# Altium schematic sheet Sheet_1_2026-11-08.schdoc
size 189 x 123 mm
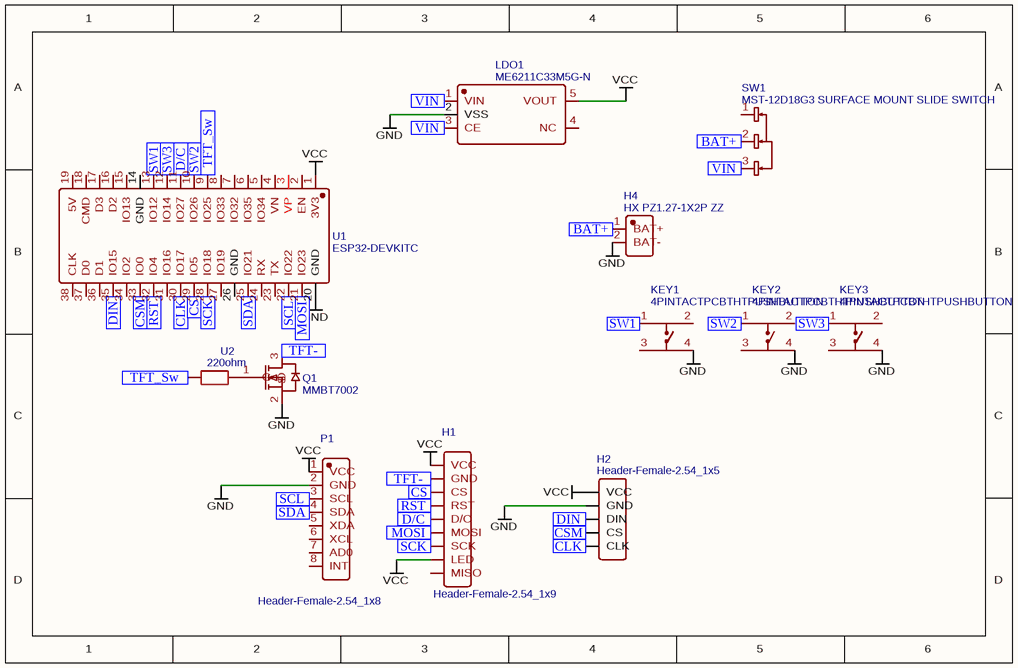
[diagram p0: Sheet_1_2026-11-08.schdoc]

## Parts
H1  Header-Female-2.54_1x9  [HDR-TH_9P-P2.54-V-F-1]
H2  Header-Female-2.54_1x5  [HDR-TH_5P-P2.54-V-F]
H4  HX PZ1.27-1X2P ZZ  [HDR-TH_HX-PZ1.27-1X2P-ZZ]
KEY1  4PINTACTPCBTHTPUSHBUTTON  [SW-SMD_4P-L6.0-W6.0-P4.50-LS10.0_TL3301EF160QG]
KEY2  4PINTACTPCBTHTPUSHBUTTON  [SW-SMD_4P-L6.0-W6.0-P4.50-LS10.0_TL3301EF160QG]
KEY3  4PINTACTPCBTHTPUSHBUTTON  [SW-SMD_4P-L6.0-W6.0-P4.50-LS10.0_TL3301EF160QG]
LDO1  ME6211C33M5G-N  [SOT-23-5_L3.0-W1.7-P0.95-LS2.8-BL]
P1  Header-Female-2.54_1x8  [HDR-TH_8P-P2.54-V-F]
Q1  MMBT7002  [SOT-23-3_L2.9-W1.6-P1.90-LS2.8-BR]
SW1  MST-12D18G3 SURFACE MOUNT SLIDE SWITCH  [SW-SMD_MST-12D18G4-SPDT-SLIDE-SWITCH]
U1  ESP32-DEVKITC  [BULETM-SMD_ESP32-DEVKITC]
U2  220ohm  [RES-TH_BD4.0-L10.7-P14.70-D0.8]

## Ports
BAT+ (in), CLK (in), CS (in), CSM (in), D/C (in), DIN (in), MOSI (in), RST (in), SCK (in), SCL (in), SDA (in), SW1 (in), SW2 (in), SW3 (in), TFT- (in), TFT_Sw (in), VIN (in)

## Nets
GND: H2.2(GND) H4.2(BAT-) KEY1.4 KEY2.4 KEY3.4 LDO1.2(VSS) P1.2(GND) Q1.2(S) U1.20(GND)
VCC: H1.1(VCC) H1.8(LED) H2.1(VCC) LDO1.5(VOUT) P1.1(VCC) U1.1(3V3)
BAT+: H4.1(BAT+) SW1.2 ; port BAT+
CLK: H2.5(CLK) U1.30(IO17) ; port CLK
CS: H1.3(CS) U1.29(IO5) ; port CS
CSM: H2.4(CS) U1.33(IO0) ; port CSM
D/C: H1.5(D/C) U1.11(IO27) ; port D/C
DIN: H2.3(DIN) U1.35(IO15) ; port DIN
MOSI: H1.6(MOSI) U1.21(IO23) ; port MOSI
RST: H1.4(RST) U1.32(IO4) ; port RST
SCK: H1.7(SCK) U1.28(IO18) ; port SCK
SCL: P1.3(SCL) U1.22(IO22) ; port SCL
SDA: P1.4(SDA) U1.25(IO21) ; port SDA
SW1: KEY1.1 U1.13(IO12) ; port SW1
SW2: KEY2.1 U1.10(IO26) ; port SW2
SW3: KEY3.1 U1.12(IO14) ; port SW3
TFT-: H1.2(GND) Q1.3(D) ; port TFT-
TFT_Sw: U1.9(IO25) U2.1 ; port TFT_Sw
VIN: LDO1.1(VIN) LDO1.3(CE) SW1.3 ; port VIN
NetQ1_1: Q1.1(G) U2.2

Not connected (* = marked no-connect by the designer): H1 9(MISO); KEY1 2 3; KEY2 2 3; KEY3 2 3; LDO1 4(NC); P1 5(XDA) 6(XCL) 7(AD0) 8(INT); SW1 1; U1 2(EN) 3(VP) 4(VN) 5(IO34) 6(IO35) 7(IO32) 8(IO33) 14(GND) 15(IO13) 16(D2) 17(D3) 18(CMD) 19(5V) 23(TX) 24(RX) 26(GND) 27(IO19) 31(IO16) 34(IO2) 36(D1) 37(D0) 38(CLK)

## Library data of the parts
H1 = Header-Female-2.54_1x9: Manufacturer: BOOMELE(博穆精密); Manufacturer Part: 2.54-1*9P母; Supplier: LCSC; Supplier Part: C39576; JLCPCB Part Class: Extended Part; spicePre: H; spiceSymbolName: Header-Female-2.54_1x9
H2 = Header-Female-2.54_1x5: Manufacturer: BOOMELE(博穆精密); Manufacturer Part: 2.54-1*5P母; Supplier: LCSC; Supplier Part: C50950; JLCPCB Part Class: Extended Part; spicePre: H; spiceSymbolName: Header-Female-2.54_1x5
H4 = HX PZ1.27-1X2P ZZ: Manufacturer: hanxia(韩下); Contributor: lcsc; Supplier: LCSC; Supplier Part: C22438099; Manufacturer Part: HX PZ1.27-1x2P ZZ; JLCPCB Part Class: Extended Part; spicePre: H; spiceSymbolName: HX PZ1.27-1X2P ZZ
KEY1-KEY3 = 4PINTACTPCBTHTPUSHBUTTON: Manufacturer: null; Contributor: LCSC; Supplier: LCSC; Supplier Part: C9900003768; Manufacturer Part: 4pinTACTPCBTHTPushButton; JLCPCB Part Class: Extended Part; spicePre: K; spiceSymbolName: 4PINTACTPCBTHTPUSHBUTTON
LDO1 = ME6211C33M5G-N: Manufacturer: MICRONE(南京微盟); Supplier: LCSC; Manufacturer Part: ME6211C33M5G-N; Supplier Part: C82942; JLCPCB Part Class: Extended Part; spicePre: L; spiceSymbolName: ME6211C33M5G-N
P1 = Header-Female-2.54_1x8: Manufacturer: BOOMELE(博穆精密); Manufacturer Part: 2.54-1*8P母环保; Supplier: LCSC; Supplier Part: C27438; JLCPCB Part Class: Extended Part; spicePre: P; spiceSymbolName: Header-Female-2.54_1x8
Q1 = MMBT7002: Manufacturer: ST(先科); Supplier: LCSC; Manufacturer Part: MMBT7002; Supplier Part: C116031; JLCPCB Part Class: Extended Part; spicePre: Q; spiceSymbolName: MMBT7002
SW1 = MST-12D18G3 SURFACE MOUNT SLIDE SWITCH: Manufacturer: SHOU HAN(首韩); Contributor: lcsc; Supplier: LCSC; Supplier Part: C49023766; Manufacturer Part: MST-12D18G3 Surface Mount Slide Switch; JLCPCB Part Class: Extended Part; spicePre: S; spiceSymbolName: MST-12D18G3 SURFACE MOUNT SLIDE SWITCH
U1 = ESP32-DEVKITC: Manufacturer: ESPRESSIF(乐鑫); Contributor: lcsc; Supplier: LCSC; Supplier Part: C571180; Manufacturer Part: ESP32-DevKitC; spicePre: U; spiceSymbolName: ESP32-DEVKITC
U2 = 220ohm: Manufacturer: Ohmite; Manufacturer Part: 21J300E; Contributor: lcsc; nameAlias: Value; Supplier: LCSC; Supplier Part: C3577537; JLCPCB Part Class: Extended Part; spicePre: U; spiceSymbolName: 21J300E